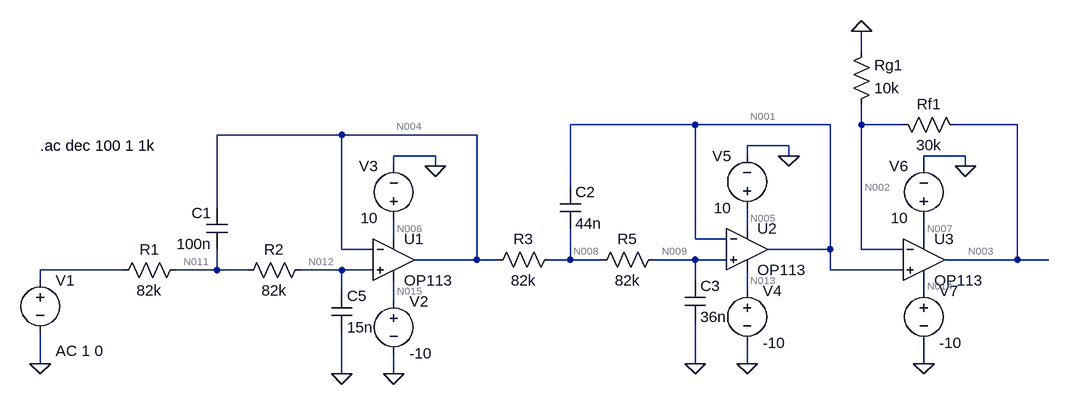
[diagram p0: schematic Draft1.asc]
Draft1.asc, the LTspice schematic file:
Version 4.1
SHEET 1 1508 680
WIRE 1216 -224 1216 -256
WIRE 960 -112 768 -112
WIRE 1168 -112 960 -112
WIRE 1216 -112 1216 -144
WIRE 1280 -112 1216 -112
WIRE 1456 -112 1360 -112
WIRE 416 -96 224 -96
WIRE 624 -96 416 -96
WIRE 1104 -80 1040 -80
WIRE 560 -64 496 -64
WIRE 1040 -64 1040 -80
WIRE 1104 -64 1104 -80
WIRE 1376 -64 1312 -64
WIRE 496 -48 496 -64
WIRE 560 -48 560 -64
WIRE 1312 -48 1312 -64
WIRE 1376 -48 1376 -64
WIRE 768 -16 768 -112
WIRE 224 16 224 -96
WIRE 1040 48 1040 16
WIRE 496 64 496 32
WIRE 960 64 960 -112
WIRE 1008 64 960 64
WIRE 1312 64 1312 32
WIRE 416 80 416 -96
WIRE 464 80 416 80
WIRE 1168 80 1168 -112
WIRE 1168 80 1072 80
WIRE 1216 80 1216 -112
WIRE 1280 80 1216 80
WIRE 624 96 624 -96
WIRE 624 96 528 96
WIRE 656 96 624 96
WIRE 768 96 768 48
WIRE 768 96 736 96
WIRE 816 96 768 96
WIRE 960 96 896 96
WIRE 1008 96 960 96
WIRE 1456 96 1456 -112
WIRE 1456 96 1344 96
WIRE 1504 96 1456 96
WIRE 80 112 -48 112
WIRE 224 112 224 80
WIRE 224 112 160 112
WIRE 272 112 224 112
WIRE 416 112 352 112
WIRE 464 112 416 112
WIRE 1168 112 1168 80
WIRE 1280 112 1168 112
WIRE -48 128 -48 112
WIRE 960 128 960 96
WIRE 416 144 416 112
WIRE 1040 144 1040 112
WIRE 1312 144 1312 128
WIRE 496 160 496 128
WIRE -48 256 -48 208
WIRE 960 256 960 192
WIRE 1040 256 1040 224
WIRE 1312 256 1312 224
WIRE 416 272 416 208
WIRE 496 272 496 240
FLAG -48 256 0
FLAG 496 272 0
FLAG 560 -48 0
FLAG 416 272 0
FLAG 1040 256 0
FLAG 1104 -64 0
FLAG 960 256 0
FLAG 1376 -48 0
FLAG 1312 256 0
FLAG 1216 -256 0
SYMBOL voltage -48 112 R0
WINDOW 123 24 124 Left 2
WINDOW 39 0 0 Left 0
SYMATTR Value2 AC 1 0
SYMATTR InstName V1
SYMATTR Value ""
SYMBOL OpAmps\\OP113 496 32 R0
SYMATTR InstName U1
SYMBOL voltage 496 144 R0
WINDOW 123 0 0 Left 0
WINDOW 39 0 0 Left 0
SYMATTR InstName V2
SYMATTR Value -10
SYMBOL voltage 496 48 R180
WINDOW 0 24 96 Left 2
WINDOW 3 24 16 Left 2
WINDOW 123 0 0 Left 0
WINDOW 39 0 0 Left 0
SYMATTR InstName V3
SYMATTR Value 10
SYMBOL OpAmps\\OP113 1040 16 R0
SYMATTR InstName U2
SYMBOL voltage 1040 128 R0
WINDOW 123 0 0 Left 0
WINDOW 39 0 0 Left 0
SYMATTR InstName V4
SYMATTR Value -10
SYMBOL voltage 1040 32 R180
WINDOW 0 24 96 Left 2
WINDOW 3 24 16 Left 2
WINDOW 123 0 0 Left 0
WINDOW 39 0 0 Left 0
SYMATTR InstName V5
SYMATTR Value 10
SYMBOL OpAmps\\OP113 1312 32 R0
SYMATTR InstName U3
SYMBOL voltage 1312 48 R180
WINDOW 0 24 96 Left 2
WINDOW 3 24 16 Left 2
WINDOW 123 0 0 Left 0
WINDOW 39 0 0 Left 0
SYMATTR InstName V6
SYMATTR Value 10
SYMBOL voltage 1312 128 R0
WINDOW 123 0 0 Left 0
WINDOW 39 0 0 Left 0
SYMATTR InstName V7
SYMATTR Value -10
SYMBOL res 1200 -128 M180
WINDOW 0 36 76 Left 2
WINDOW 3 36 40 Left 2
SYMATTR InstName Rg1
SYMATTR Value 10k
SYMBOL res 1376 -96 M270
WINDOW 0 32 56 VTop 2
WINDOW 3 0 56 VBottom 2
SYMATTR InstName Rf1
SYMATTR Value 30k
SYMBOL cap 240 80 R180
WINDOW 0 24 56 Left 2
WINDOW 3 24 8 Left 2
SYMATTR InstName C1
SYMATTR Value 100n
SYMBOL res 176 96 R90
WINDOW 0 0 56 VBottom 2
WINDOW 3 32 56 VTop 2
SYMATTR InstName R1
SYMATTR Value 82k
SYMBOL cap 400 144 R0
SYMATTR InstName C5
SYMATTR Value 15n
SYMBOL res 368 96 R90
WINDOW 0 0 56 VBottom 2
WINDOW 3 32 56 VTop 2
SYMATTR InstName R2
SYMATTR Value 82k
SYMBOL res 752 80 R90
WINDOW 0 0 56 VBottom 2
WINDOW 3 32 56 VTop 2
SYMATTR InstName R3
SYMATTR Value 82k
SYMBOL cap 752 -16 R0
SYMATTR InstName C2
SYMATTR Value 44n
SYMBOL res 912 80 R90
WINDOW 0 0 56 VBottom 2
WINDOW 3 32 56 VTop 2
SYMATTR InstName R5
SYMATTR Value 82k
SYMBOL cap 944 128 R0
SYMATTR InstName C3
SYMATTR Value 36n
TEXT -48 -80 Left 2 !.ac dec 100 1 1k

The netlist it stands for:
* Draft1.asc
V1 N010 0 AC 1 0
X§U1 N012 N004 N006 N015 N004 OP113  ; pins In+ In- V+ V- OUT
V2 N015 0 -10
V3 N006 0 10
X§U2 N009 N001 N005 N013 N001 OP113  ; pins In+ In- V+ V- OUT
V4 N013 0 -10
V5 N005 0 10
X§U3 N001 N002 N007 N014 N003 OP113  ; pins In+ In- V+ V- OUT
V6 N007 0 10
V7 N014 0 -10
Rg1 N002 0 10k
Rf1 N003 N002 30k
C1 N011 N004 100n
R1 N011 N010 82k
C5 N012 0 15n
R2 N012 N011 82k
R3 N008 N004 82k
C2 N001 N008 44n
R5 N009 N008 82k
C3 N009 0 36n
.ac dec 100 1 1k
.lib ADI.lib
.backanno
.end

* Results of the author's LTspice run, read from the files saved beside the schematic
* Operating Point, zero values left out:
*   V(n012) = 43.43 mV
*   V(n006) = 10 V
*   V(n015) = -10 V
*   V(n001) = 86.81 mV
*   V(n002) = 86.78 mV
*   V(n014) = -10 V
*   V(n003) = 340.7 mV
*   V(n008) = 65.12 mV
*   V(n004) = 43.4 mV
*   V(n009) = 86.83 mV
*   V(n005) = 10 V
*   V(n013) = -10 V
*   V(n007) = 10 V
*   V(n011) = 21.71 mV
*   I(V1) = 264.8 nA
*   I(V7) = 1.523 mA
*   I(Rg1) = 8.678 µA
*   I(R2) = 264.8 nA
*   I(V3) = -1.525 mA
*   I(V4) = 1.525 mA
*   I(V5) = -1.525 mA
*   I(Rf1) = 8.463 µA
*   I(R3) = 264.8 nA
*   I(R5) = 264.8 nA
*   I(V2) = 1.525 mA
*   I(V6) = -1.532 mA
*   I(R1) = 264.8 nA
*   Ix(u2:3) = -264.8 nA
*   Ix(u2:2) = -214.8 nA
*   Ix(u2:7) = 1.525 mA
*   Ix(u2:4) = -1.525 mA
*   Ix(u2:6) = 479.6 nA
*   Ix(u1:3) = -264.8 nA
*   Ix(u1:2) = -214.8 nA
*   Ix(u1:7) = 1.525 mA
*   Ix(u1:4) = -1.525 mA
*   Ix(u1:6) = 479.6 nA
*   Ix(u3:3) = -264.8 nA
*   Ix(u3:2) = -214.8 nA
*   Ix(u3:7) = 1.532 mA
*   Ix(u3:4) = -1.523 mA
*   Ix(u3:6) = -8.463 µA
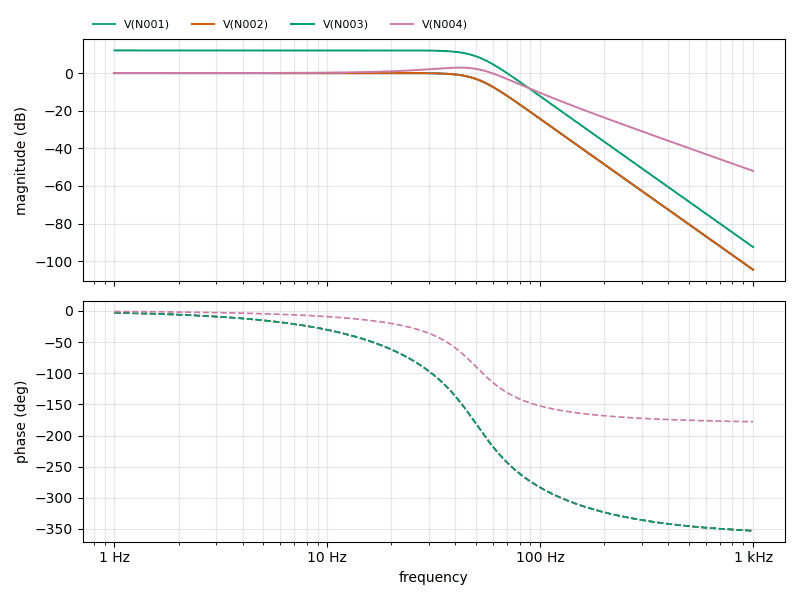
[diagram p1: AC Analysis of Draft1.asc, plotted from the saved traces]
* AC Analysis, 1 run:
*   V(N001): 0.00 dB at 1 Hz, -104.48 dB at 1 kHz, peak 0.02 dB at 17.78 Hz, 3 dB below the peak at 49.59 Hz
*   V(N002): 0.00 dB at 1 Hz, -104.48 dB at 1 kHz, peak 0.02 dB at 17.78 Hz, 3 dB below the peak at 49.59 Hz
*   V(N003): 12.04 dB at 1 Hz, -92.43 dB at 1 kHz, peak 12.06 dB at 17.78 Hz, 3 dB below the peak at 49.59 Hz
*   V(N004): 0.00 dB at 1 Hz, -51.99 dB at 1 kHz, peak 2.92 dB at 41.69 Hz, 3 dB below the peak at 59.59 Hz